# Altium schematic sheet ArrayPCIE.SchDoc
size B
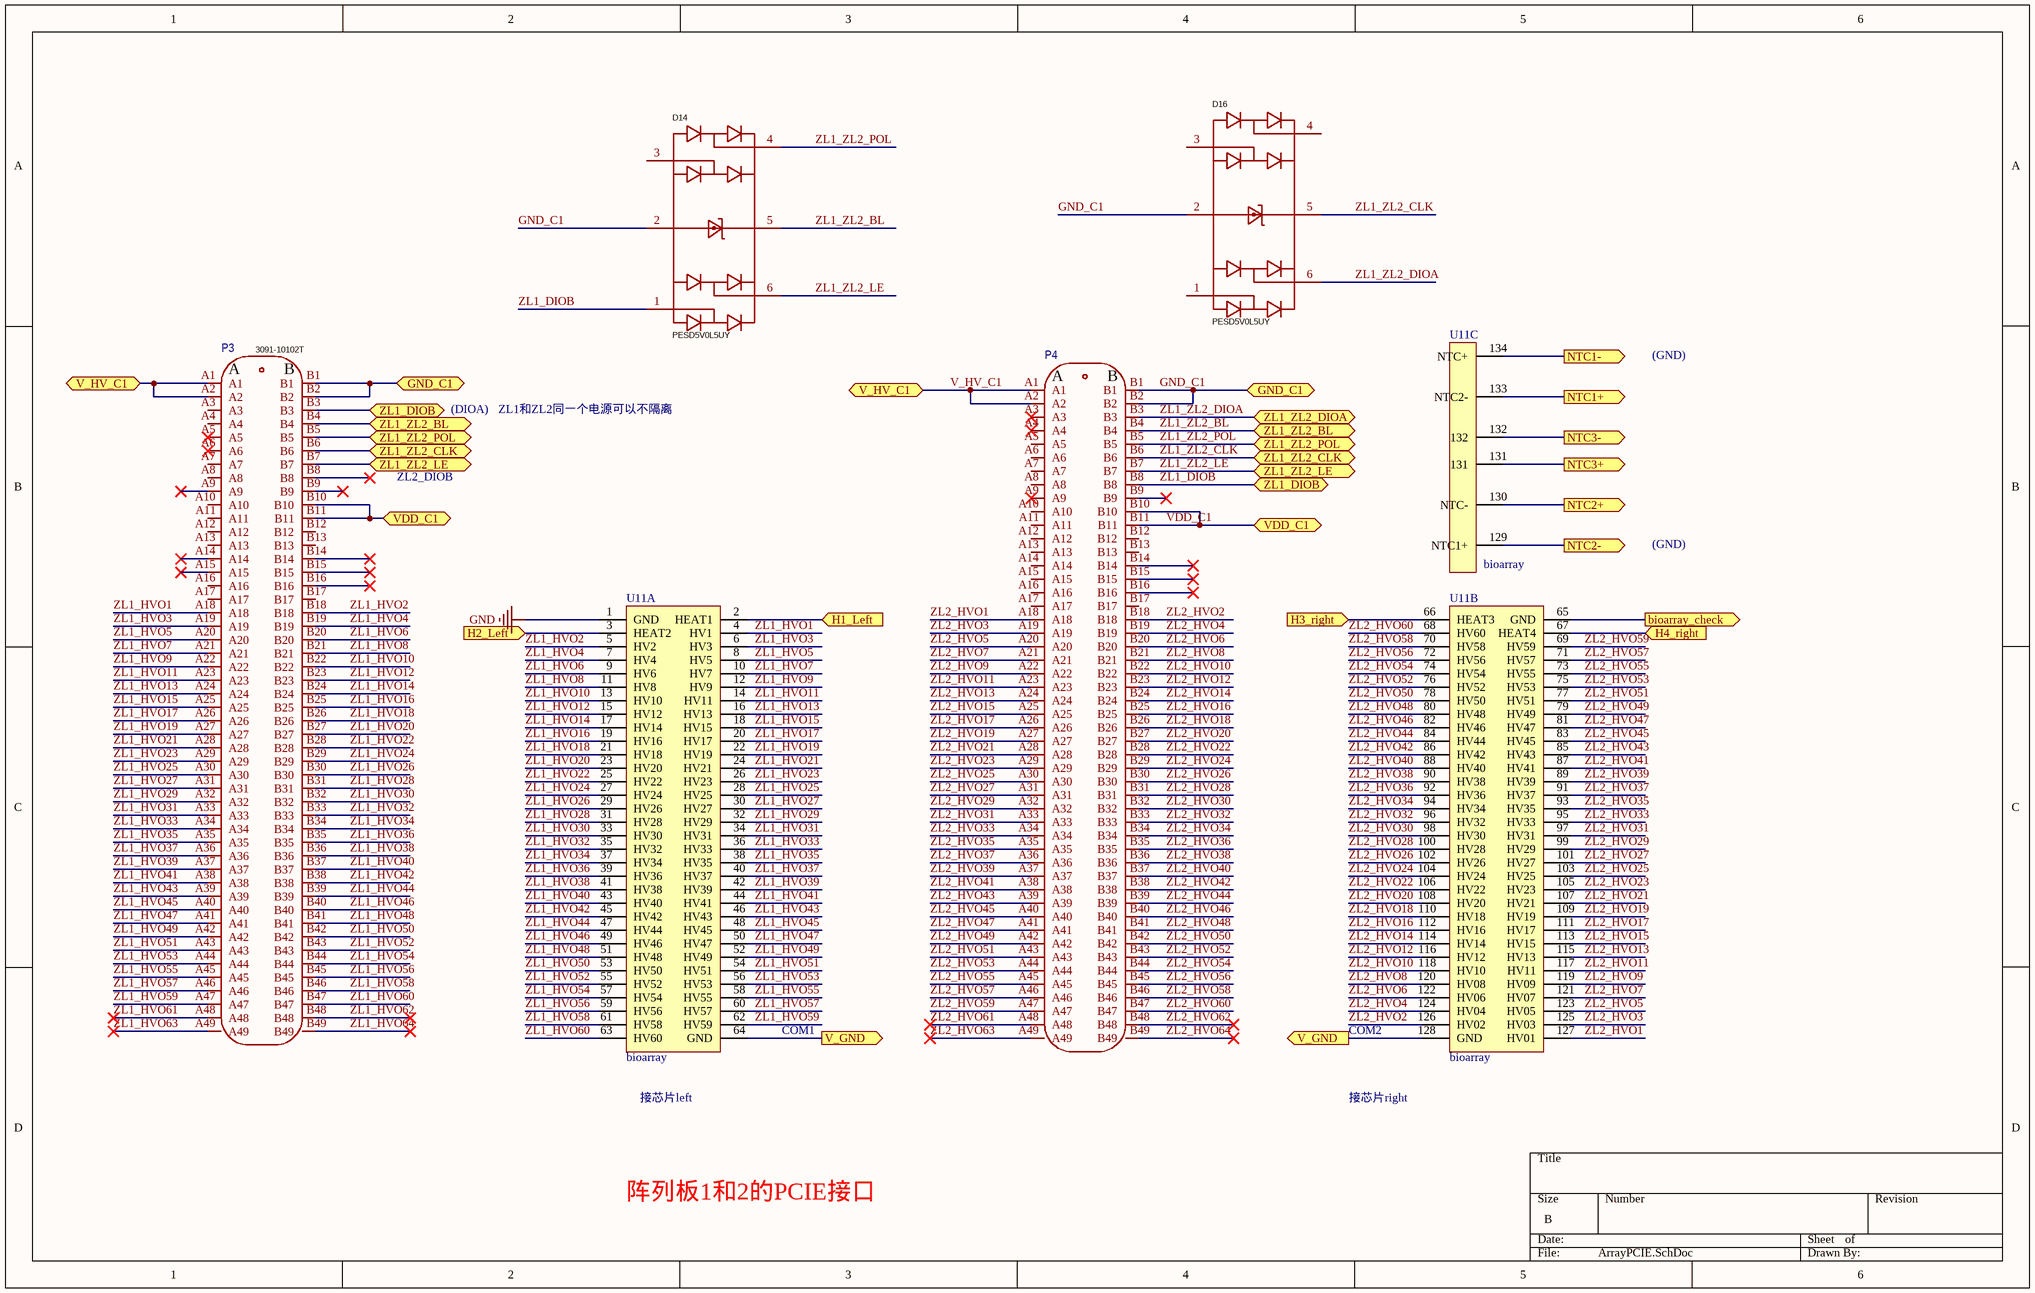
[diagram p0: ArrayPCIE.SchDoc]

## Parts
D14  PESD5V0L5UY  [SOT-363_L2.1-W1.3-P0.65-LS2.2-BL]
D16  PESD5V0L5UY  [SOT-363_L2.1-W1.3-P0.65-LS2.2-BL]
P3  3091-10102T  [CONN-TH_98P-P1.00-V_3183-XXXXXPXT]
P4  3091-10102T  [CONN-TH_98P-P1.00-V_3183-XXXXXPXT]  (value not drawn)
U11  bioarray  [Bioarray]  (parts A,B,C of 3)

## Ports
bioarray_check (out), GND_C1, H1_Left (in), H2_Left (in), H3_right (in), H4_right (in), NTC1+ (out), NTC1- (out), NTC2+ (out), NTC2- (out), NTC3+ (out), NTC3- (out), V_GND (out), V_HV_C1, VDD_C1, ZL1_DIOB, ZL1_ZL2_BL, ZL1_ZL2_CLK, ZL1_ZL2_DIOA, ZL1_ZL2_LE, ZL1_ZL2_POL

## Nets
GND: U11.1(GND)
bioarray_check: U11.65(GND) ; port bioarray_check
GND_C1: D14.2 D16.2 P3.B1 P3.B2 P4.B1 P4.B2 ; port GND_C1
H1_Left: U11.2(HEAT1) ; port H1_Left
H2_Left: U11.3(HEAT2) ; port H2_Left
H3_right: U11.66(HEAT3) ; port H3_right
H4_right: U11.67(HEAT4) ; port H4_right
NTC1+: U11.133(NTC2-) ; port NTC1+
NTC1-: U11.134(NTC+) ; port NTC1-
NTC2+: U11.130(NTC-) ; port NTC2+
NTC2-: U11.129(NTC1+) ; port NTC2-
NTC3+: U11.131 ; port NTC3+
NTC3-: U11.132 ; port NTC3-
V_GND: U11.64(GND) U11.128(GND) ; port V_GND
V_HV_C1: P3.A1 P3.A2 P4.A1 P4.A2 ; port V_HV_C1
VDD_C1: P3.B10 P3.B11 P4.B10 P4.B11 ; port VDD_C1
ZL1_DIOB: D14.1 P3.B3 P4.B8 ; port ZL1_DIOB
ZL1_HVO1: P3.A18 U11.4(HV1)
ZL1_HVO2: P3.B18 U11.5(HV2)
ZL1_HVO3: P3.A19 U11.6(HV3)
ZL1_HVO4: P3.B19 U11.7(HV4)
ZL1_HVO5: P3.A20 U11.8(HV5)
ZL1_HVO6: P3.B20 U11.9(HV6)
ZL1_HVO7: P3.A21 U11.10(HV7)
ZL1_HVO8: P3.B21 U11.11(HV8)
ZL1_HVO9: P3.A22 U11.12(HV9)
ZL1_HVO10: P3.B22 U11.13(HV10)
ZL1_HVO11: P3.A23 U11.14(HV11)
ZL1_HVO12: P3.B23 U11.15(HV12)
ZL1_HVO13: P3.A24 U11.16(HV13)
ZL1_HVO14: P3.B24 U11.17(HV14)
ZL1_HVO15: P3.A25 U11.18(HV15)
ZL1_HVO16: P3.B25 U11.19(HV16)
ZL1_HVO17: P3.A26 U11.20(HV17)
ZL1_HVO18: P3.B26 U11.21(HV18)
ZL1_HVO19: P3.A27 U11.22(HV19)
ZL1_HVO20: P3.B27 U11.23(HV20)
ZL1_HVO21: P3.A28 U11.24(HV21)
ZL1_HVO22: P3.B28 U11.25(HV22)
ZL1_HVO23: P3.A29 U11.26(HV23)
ZL1_HVO24: P3.B29 U11.27(HV24)
ZL1_HVO25: P3.A30 U11.28(HV25)
ZL1_HVO26: P3.B30 U11.29(HV26)
ZL1_HVO27: P3.A31 U11.30(HV27)
ZL1_HVO28: P3.B31 U11.31(HV28)
ZL1_HVO29: P3.A32 U11.32(HV29)
ZL1_HVO30: P3.B32 U11.33(HV30)
ZL1_HVO31: P3.A33 U11.34(HV31)
ZL1_HVO32: P3.B33 U11.35(HV32)
ZL1_HVO33: P3.A34 U11.36(HV33)
ZL1_HVO34: P3.B34 U11.37(HV34)
ZL1_HVO35: P3.A35 U11.38(HV35)
ZL1_HVO36: P3.B35 U11.39(HV36)
ZL1_HVO37: P3.A36 U11.40(HV37)
ZL1_HVO38: P3.B36 U11.41(HV38)
ZL1_HVO39: P3.A37 U11.42(HV39)
ZL1_HVO40: P3.B37 U11.43(HV40)
ZL1_HVO41: P3.A38 U11.44(HV41)
ZL1_HVO42: P3.B38 U11.45(HV42)
ZL1_HVO43: P3.A39 U11.46(HV43)
ZL1_HVO44: P3.B39 U11.47(HV44)
ZL1_HVO45: P3.A40 U11.48(HV45)
ZL1_HVO46: P3.B40 U11.49(HV46)
ZL1_HVO47: P3.A41 U11.50(HV47)
ZL1_HVO48: P3.B41 U11.51(HV48)
ZL1_HVO49: P3.A42 U11.52(HV49)
ZL1_HVO50: P3.B42 U11.53(HV50)
ZL1_HVO51: P3.A43 U11.54(HV51)
ZL1_HVO52: P3.B43 U11.55(HV52)
ZL1_HVO53: P3.A44 U11.56(HV53)
ZL1_HVO54: P3.B44 U11.57(HV54)
ZL1_HVO55: P3.A45 U11.58(HV55)
ZL1_HVO56: P3.B45 U11.59(HV56)
ZL1_HVO57: P3.A46 U11.60(HV57)
ZL1_HVO58: P3.B46 U11.61(HV58)
ZL1_HVO59: P3.A47 U11.62(HV59)
ZL1_HVO60: P3.B47 U11.63(HV60)
ZL1_HVO61: P3.A48
ZL1_HVO62: P3.B48
ZL1_HVO63: P3.A49
ZL1_HVO64: P3.B49
ZL1_ZL2_BL: D14.5 P3.B4 P4.B4 ; port ZL1_ZL2_BL
ZL1_ZL2_CLK: D16.5 P3.B6 P4.B6 ; port ZL1_ZL2_CLK
ZL1_ZL2_DIOA: D16.6 P4.B3 ; port ZL1_ZL2_DIOA
ZL1_ZL2_LE: D14.6 P3.B7 P4.B7 ; port ZL1_ZL2_LE
ZL1_ZL2_POL: D14.4 P3.B5 P4.B5 ; port ZL1_ZL2_POL
ZL2_HVO1: P4.A18 U11.127(HV01)
ZL2_HVO2: P4.B18 U11.126(HV02)
ZL2_HVO3: P4.A19 U11.125(HV03)
ZL2_HVO4: P4.B19 U11.124(HV04)
ZL2_HVO5: P4.A20 U11.123(HV05)
ZL2_HVO6: P4.B20 U11.122(HV06)
ZL2_HVO7: P4.A21 U11.121(HV07)
ZL2_HVO8: P4.B21 U11.120(HV08)
ZL2_HVO9: P4.A22 U11.119(HV09)
ZL2_HVO10: P4.B22 U11.118(HV10)
ZL2_HVO11: P4.A23 U11.117(HV11)
ZL2_HVO12: P4.B23 U11.116(HV12)
ZL2_HVO13: P4.A24 U11.115(HV13)
ZL2_HVO14: P4.B24 U11.114(HV14)
ZL2_HVO15: P4.A25 U11.113(HV15)
ZL2_HVO16: P4.B25 U11.112(HV16)
ZL2_HVO17: P4.A26 U11.111(HV17)
ZL2_HVO18: P4.B26 U11.110(HV18)
ZL2_HVO19: P4.A27 U11.109(HV19)
ZL2_HVO20: P4.B27 U11.108(HV20)
ZL2_HVO21: P4.A28 U11.107(HV21)
ZL2_HVO22: P4.B28 U11.106(HV22)
ZL2_HVO23: P4.A29 U11.105(HV23)
ZL2_HVO24: P4.B29 U11.104(HV24)
ZL2_HVO25: P4.A30 U11.103(HV25)
ZL2_HVO26: P4.B30 U11.102(HV26)
ZL2_HVO27: P4.A31 U11.101(HV27)
ZL2_HVO28: P4.B31 U11.100(HV28)
ZL2_HVO29: P4.A32 U11.99(HV29)
ZL2_HVO30: P4.B32 U11.98(HV30)
ZL2_HVO31: P4.A33 U11.97(HV31)
ZL2_HVO32: P4.B33 U11.96(HV32)
ZL2_HVO33: P4.A34 U11.95(HV33)
ZL2_HVO34: P4.B34 U11.94(HV34)
ZL2_HVO35: P4.A35 U11.93(HV35)
ZL2_HVO36: P4.B35 U11.92(HV36)
ZL2_HVO37: P4.A36 U11.91(HV37)
ZL2_HVO38: P4.B36 U11.90(HV38)
ZL2_HVO39: P4.A37 U11.89(HV39)
ZL2_HVO40: P4.B37 U11.88(HV40)
ZL2_HVO41: P4.A38 U11.87(HV41)
ZL2_HVO42: P4.B38 U11.86(HV42)
ZL2_HVO43: P4.A39 U11.85(HV43)
ZL2_HVO44: P4.B39 U11.84(HV44)
ZL2_HVO45: P4.A40 U11.83(HV45)
ZL2_HVO46: P4.B40 U11.82(HV46)
ZL2_HVO47: P4.A41 U11.81(HV47)
ZL2_HVO48: P4.B41 U11.80(HV48)
ZL2_HVO49: P4.A42 U11.79(HV49)
ZL2_HVO50: P4.B42 U11.78(HV50)
ZL2_HVO51: P4.A43 U11.77(HV51)
ZL2_HVO52: P4.B43 U11.76(HV52)
ZL2_HVO53: P4.A44 U11.75(HV53)
ZL2_HVO54: P4.B44 U11.74(HV54)
ZL2_HVO55: P4.A45 U11.73(HV55)
ZL2_HVO56: P4.B45 U11.72(HV56)
ZL2_HVO57: P4.A46 U11.71(HV57)
ZL2_HVO58: P4.B46 U11.70(HV58)
ZL2_HVO59: P4.A47 U11.69(HV59)
ZL2_HVO60: P4.B47 U11.68(HV60)
ZL2_HVO61: P4.A48
ZL2_HVO62: P4.B48
ZL2_HVO63: P4.A49
ZL2_HVO64: P4.B49

Not connected (* = marked no-connect by the designer): D14 3; D16 1 3 4; P3 A3 A4 A5* A6* A7 A8 A9* A10 A11 A12 A13 A14* A15* A16 A17 B8* B9* B12 B13 B14* B15* B16* B17; P4 A3* A4* A5 A6 A7 A8 A9* A10 A11 A12 A13 A14 A15 A16 A17 B9* B12 B13 B14* B15* B16* B17

## Notes on the sheet
- (GND)
- (DIOA)
- ZL1和ZL2同一个电源可以不隔离
- ZL2_DIOB
- COM1
- COM2
- 接芯片left
- 接芯片right
- 阵列板1和2的PCIE接口
- (in symbol 3091-10102T) A; B

## Library data of the parts
D14 D16 = PESD5V0L5UY: Symbol: PESD5V0L5UY_C2831528; Add into BOM: yes; Device: PESD5V0L5UY; LCSC Part Name: PESD5V0L5UY; Supplier Part: C2831528; Manufacturer Part: PESD5V0L5UY; Supplier Footprint: SOT-363; JLCPCB Part Class: Extended Part; Datasheet: https://atta.szlcsc.com/upload/public/pdf/source/20231109/DCE732989771725E823DBBA058DFF8E3.pdf; Supplier: LCSC; Convert to PCB: yes
P3 P4 = 3091-10102T: Add into BOM: yes; Connector Type: PCI-E x8; Number of Data Pins: 76P; Body Height: 9.4mm; Symbol: 3091-10102T; Device: 3091-10102T; Supplier Part: C444346; Manufacturer Part: 3091-10102T; JLCPCB Part Class: Extended Part; Datasheet: https://atta.szlcsc.com/upload/public/pdf/source/20221109/CB0226233DC893B6403D2B106A3D8F66.pdf; Supplier: LCSC; Convert to PCB: yes; Number of Pins: 98P; Versions: -; Operating Temperature Range: -; Comment_1: 3091-10102T